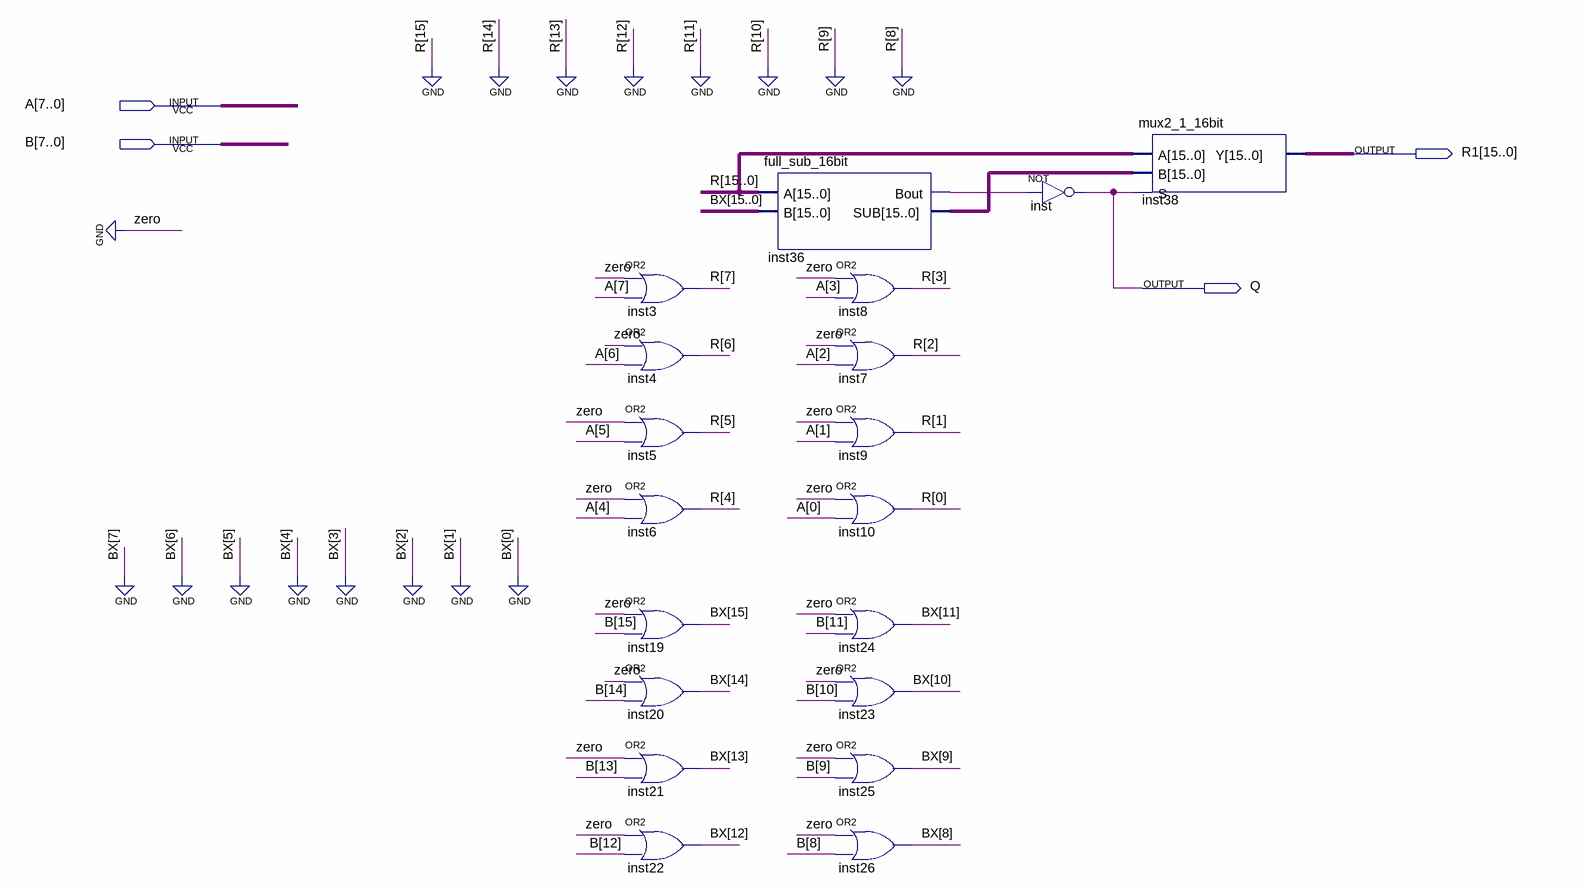
[diagram p0: schematic sheet]
// Quartus schematic mach_chia1.bdf as structural Verilog: 19 symbols, 4 pins
module mach_chia1 (
  input  [7:0] A,
  input  [15:0] B,
  output [15:0] R1,
  output Q
);

  wire inst36_bout;
  wire [7:0] R;
  wire [15:0] inst36_sub;
  wire [15:8] BX;

  or inst3 (R[7], 1'b0, A[7]);
  or inst4 (R[6], 1'b0, A[6]);
  or inst5 (R[5], 1'b0, A[5]);
  or inst6 (R[4], 1'b0, A[4]);
  or inst19 (BX[15], 1'b0, B[15]);
  or inst20 (BX[14], 1'b0, B[14]);
  or inst21 (BX[13], 1'b0, B[13]);
  or inst22 (BX[12], 1'b0, B[12]);
  full_sub_16bit inst36 (.A({{8{1'b0}}, R}), .B({BX, {8{1'b0}}}), .Bout(inst36_bout), .SUB(inst36_sub));
  or inst8 (R[3], 1'b0, A[3]);
  or inst7 (R[2], 1'b0, A[2]);
  or inst9 (R[1], 1'b0, A[1]);
  or inst10 (R[0], 1'b0, A[0]);
  or inst24 (BX[11], 1'b0, B[11]);
  or inst23 (BX[10], 1'b0, B[10]);
  or inst25 (BX[9], 1'b0, B[9]);
  or inst26 (BX[8], 1'b0, B[8]);
  not inst (Q, inst36_bout);
  mux2_1_16bit inst38 (.A({{8{1'b0}}, R}), .B(inst36_sub), .S(Q), .Y(R1));
endmodule
